# Altium project Rover_Carrier.PrjPcb
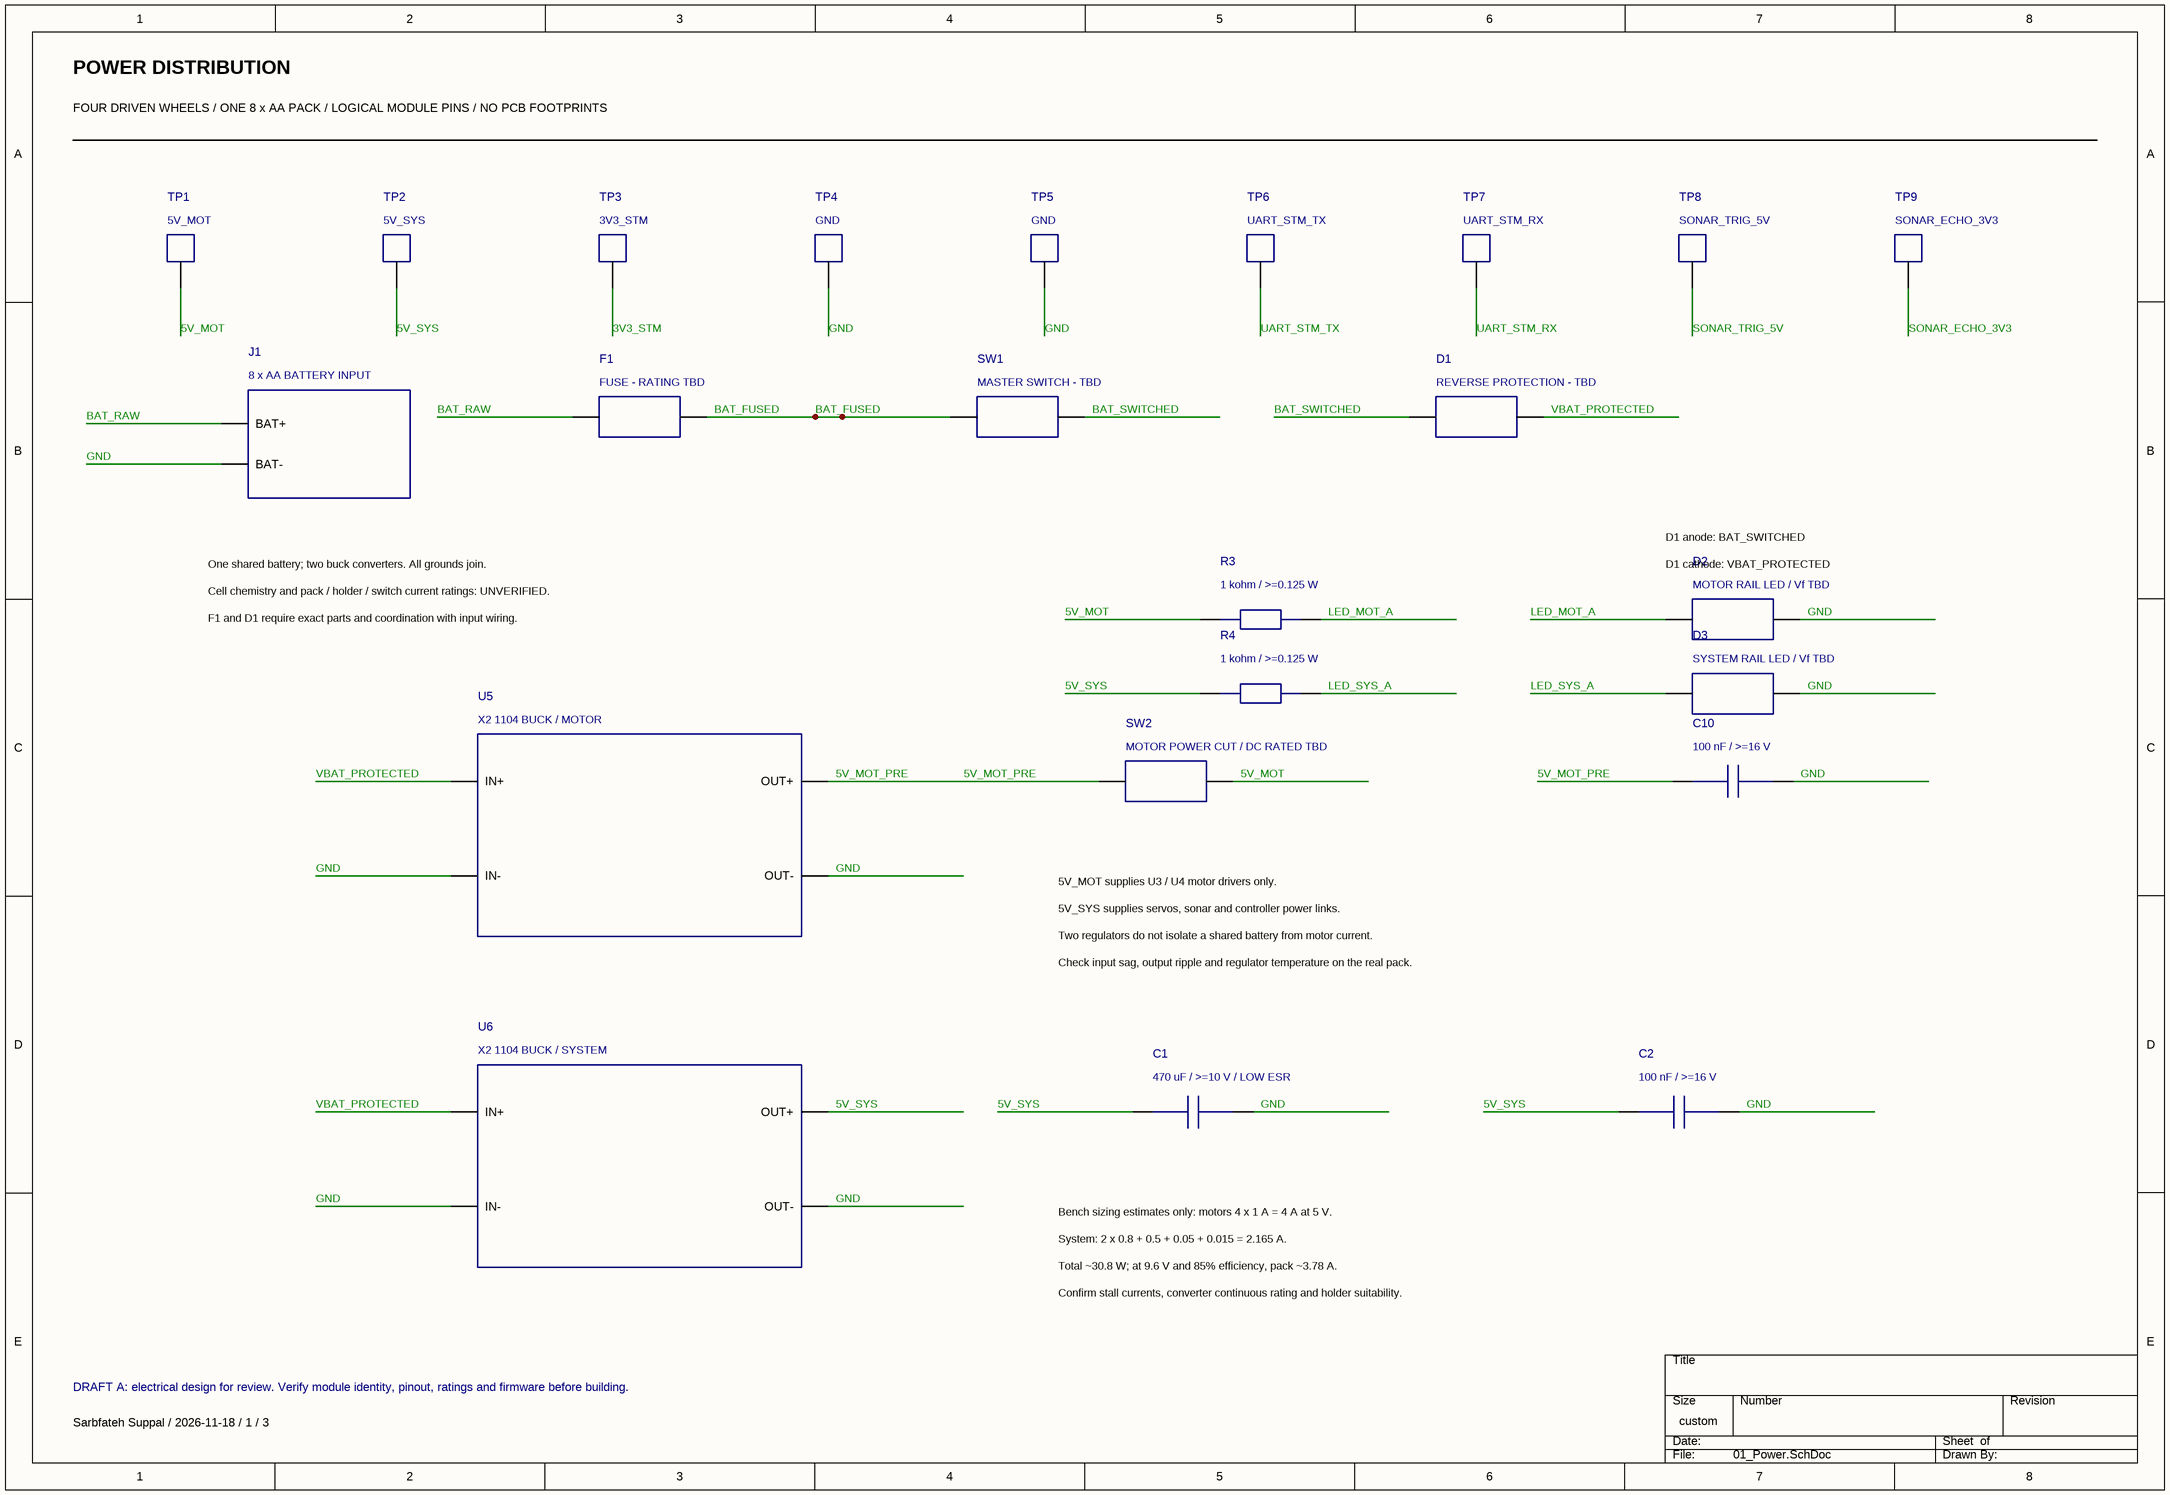
[diagram p0: 01_Power.SchDoc]
3 sheets, 55 parts. Net scope: global (net labels, ports and power ports of the same name join across sheets).
Sheets:
  01_Power.SchDoc
  02_Control_and_Sensors.SchDoc
  03_Drivers_and_Sonar.SchDoc

## Sheet 01_Power.SchDoc: POWER DISTRIBUTION
size 406 x 279 mm; Revision: A - DRAFT; Date: 2026-11-18; SheetNumber: 1; SheetTotal: 3; Author: Sarbfateh Suppal; DocumentNumber: ROVER-A-1; ProjectName: Four-motor Rover Carrier

### Parts
C1  470 uF / >=10 V / LOW ESR
C2  100 nF / >=16 V
C10  100 nF / >=16 V
D1  REVERSE PROTECTION - TBD
D2  MOTOR RAIL LED / Vf TBD
D3  SYSTEM RAIL LED / Vf TBD
F1  FUSE - RATING TBD
J1  8 x AA BATTERY INPUT
R3  1 kohm / >=0.125 W
R4  1 kohm / >=0.125 W
SW1  MASTER SWITCH - TBD
SW2  MOTOR POWER CUT / DC RATED TBD
TP1  5V_MOT
TP2  5V_SYS
TP3  3V3_STM
TP4  GND
TP5  GND
TP6  UART_STM_TX
TP7  UART_STM_RX
TP8  SONAR_TRIG_5V
TP9  SONAR_ECHO_3V3
U5  X2 1104 BUCK / MOTOR
U6  X2 1104 BUCK / SYSTEM

### Nets
3V3_STM: TP3.1
5V_MOT: R3.1 SW2.2 TP1.1
5V_MOT_PRE: C10.1 SW2.1 U5.OUT+
5V_SYS: C1.1 C2.1 R4.1 TP2.1 U6.OUT+
BAT_FUSED: F1.2 SW1.1
BAT_RAW: F1.1 J1.1(BAT+)
BAT_SWITCHED: D1.1 SW1.2
GND: C1.2 C2.2 C10.2 D2.2 D3.2 J1.2(BAT-) TP4.1 TP5.1 U5.IN- U5.OUT- U6.IN- U6.OUT-
LED_MOT_A: D2.1 R3.2
LED_SYS_A: D3.1 R4.2
SONAR_ECHO_3V3: TP9.1
SONAR_TRIG_5V: TP8.1
UART_STM_RX: TP7.1
UART_STM_TX: TP6.1
VBAT_PROTECTED: D1.2 U5.IN+ U6.IN+

### Notes on the sheet
- POWER DISTRIBUTION
- FOUR DRIVEN WHEELS / ONE 8 x AA PACK / LOGICAL MODULE PINS / NO PCB FOOTPRINTS
- One shared battery; two buck converters. All grounds join.
- D1 anode: BAT_SWITCHED
- (near D2) D1 cathode: VBAT_PROTECTED
- Cell chemistry and pack / holder / switch current ratings: UNVERIFIED.
- F1 and D1 require exact parts and coordination with input wiring.
- 5V_MOT supplies U3 / U4 motor drivers only.
- 5V_SYS supplies servos, sonar and controller power links.
- Two regulators do not isolate a shared battery from motor current.
- Check input sag, output ripple and regulator temperature on the real pack.
- Bench sizing estimates only: motors 4 x 1 A = 4 A at 5 V.
- System: 2 x 0.8 + 0.5 + 0.05 + 0.015 = 2.165 A.
- Total ~30.8 W; at 9.6 V and 85% efficiency, pack ~3.78 A.
- Confirm stall currents, converter continuous rating and holder suitability.
- DRAFT A: electrical design for review. Verify module identity, pinout, ratings and firmware before building.
- Sarbfateh Suppal / 2026-11-18 / 1 / 3

### Library data of the parts
C1 = capacitor_C1
C2 = capacitor_C2
C10 = capacitor_C10
D1 = diode_D1
D2 = led_D2
D3 = led_D3
F1 = fuse_F1
J1 = module_J1
R3 = resistor_R3
R4 = resistor_R4
SW1 = switch_SW1
SW2 = switch_SW2
TP1 = testpoint_TP1
TP2 = testpoint_TP2
TP3 = testpoint_TP3
TP4 = testpoint_TP4
TP5 = testpoint_TP5
TP6 = testpoint_TP6
TP7 = testpoint_TP7
TP8 = testpoint_TP8
TP9 = testpoint_TP9
U5 = module_U5
U6 = module_U6

## Sheet 02_Control_and_Sensors.SchDoc: CONTROLLERS, STEERING AND ULTRASONIC SENSOR
size 406 x 279 mm; Revision: A - DRAFT; Date: 2026-11-18; SheetNumber: 2; SheetTotal: 3; Author: Sarbfateh Suppal; DocumentNumber: ROVER-A-2; ProjectName: Four-motor Rover Carrier
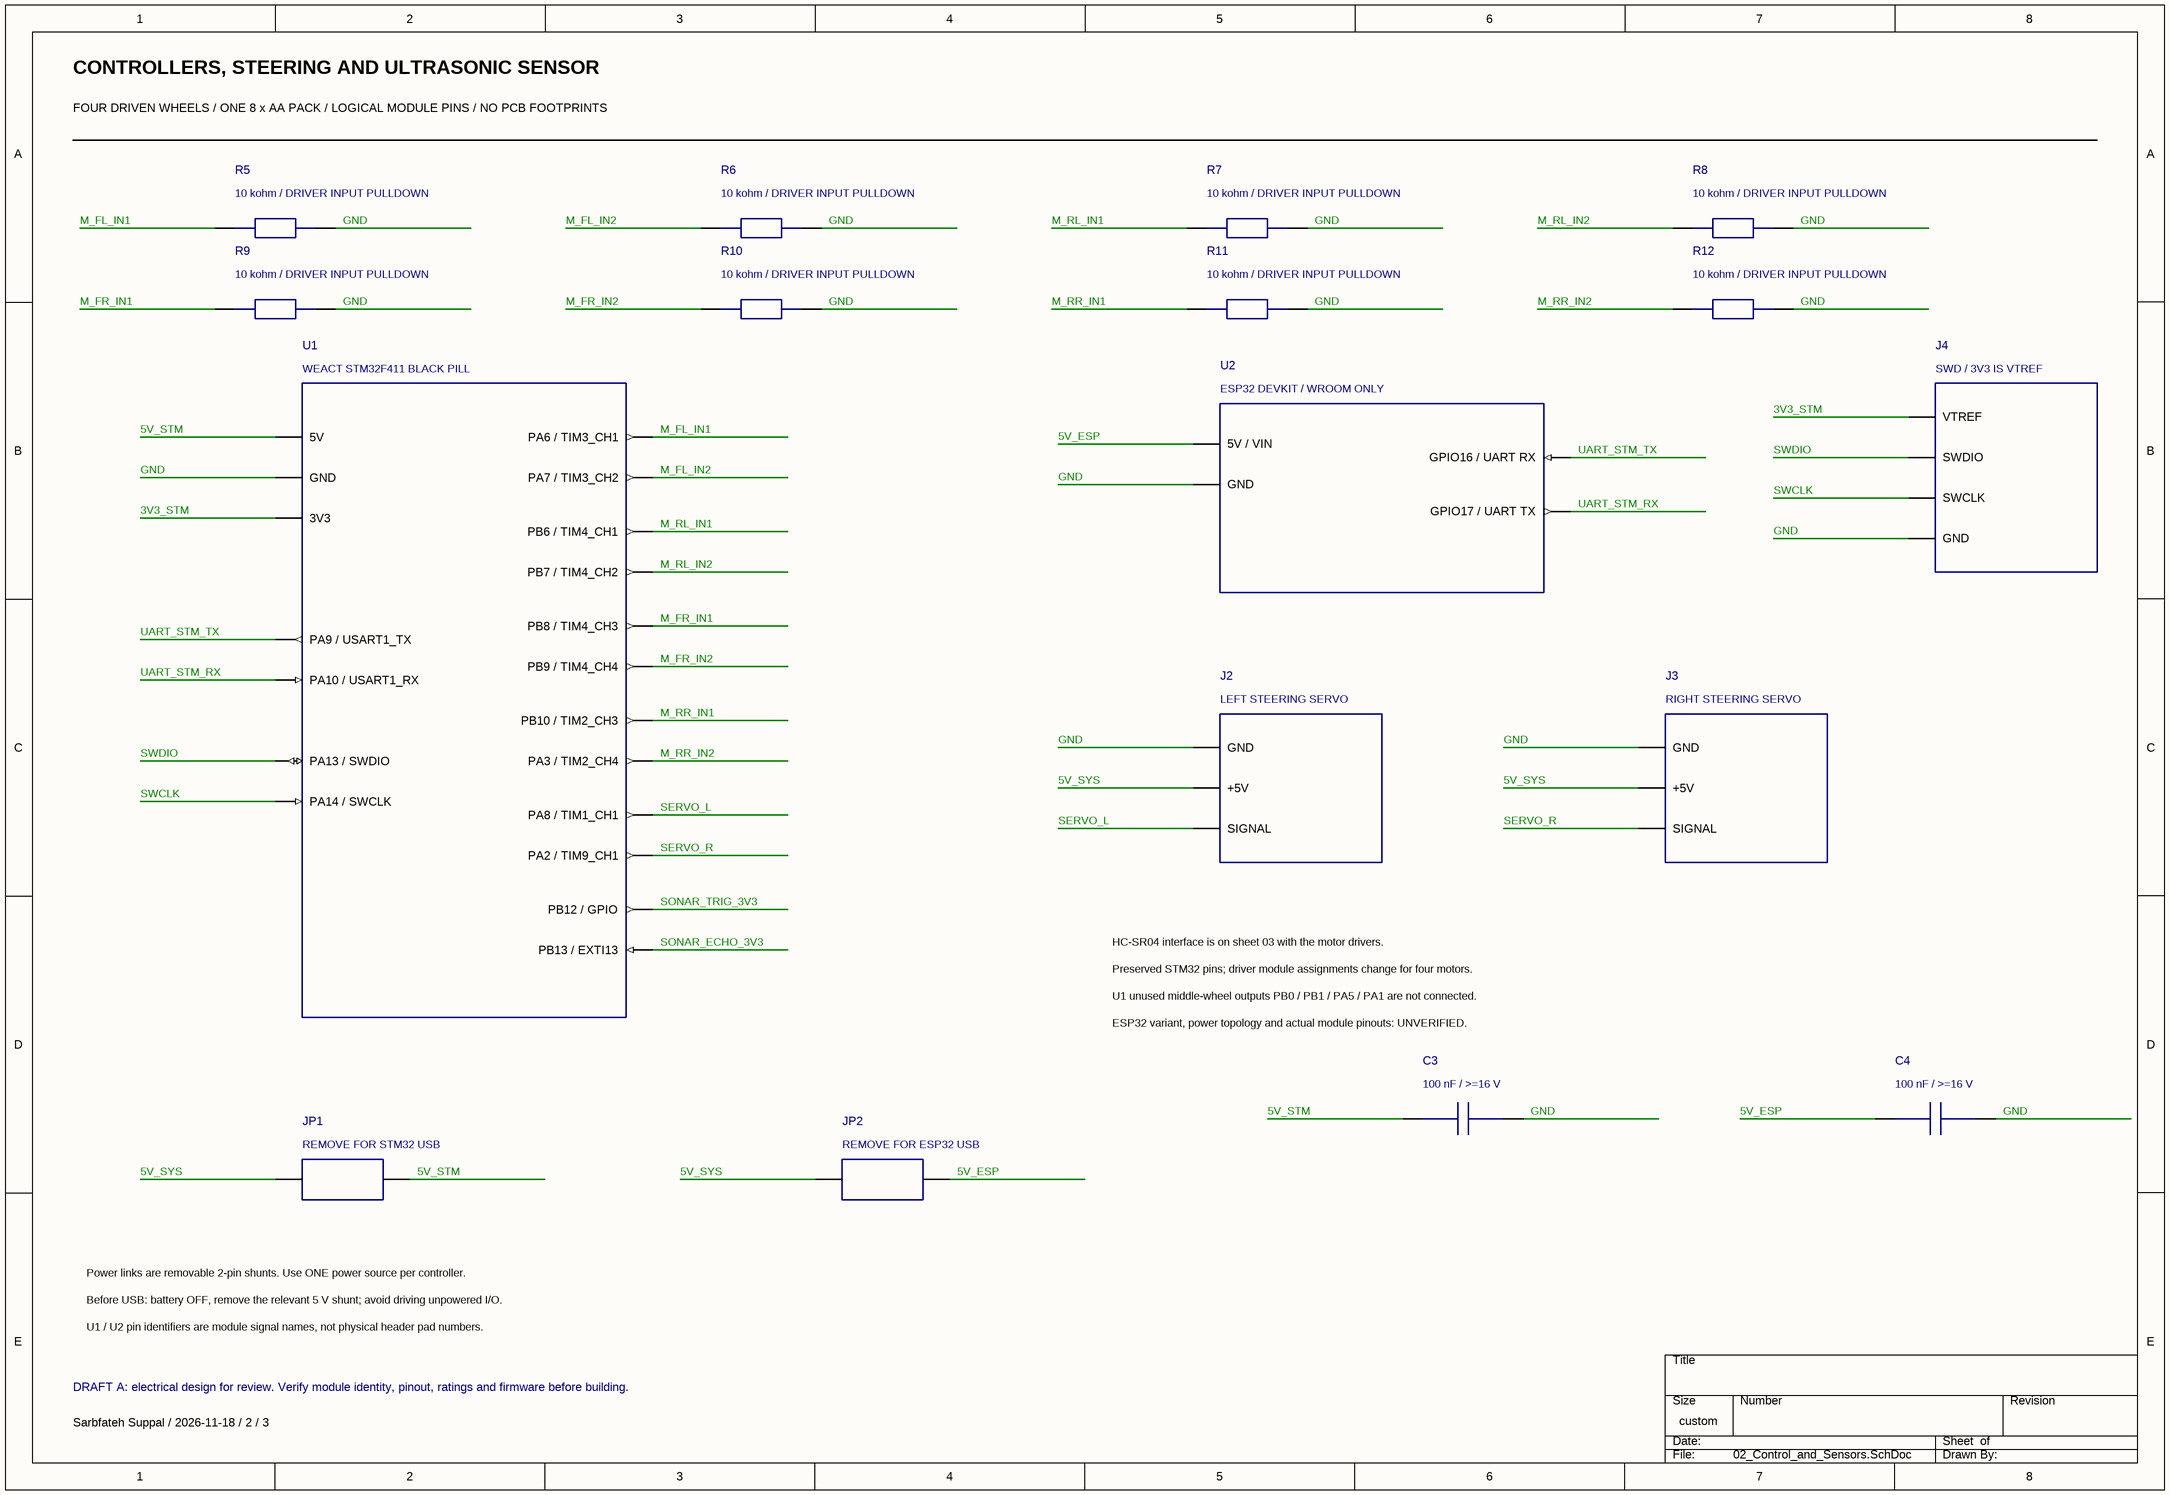
[diagram p1: 02_Control_and_Sensors.SchDoc]

### Parts
C3  100 nF / >=16 V
C4  100 nF / >=16 V
J2  LEFT STEERING SERVO
J3  RIGHT STEERING SERVO
J4  SWD / 3V3 IS VTREF
JP1  REMOVE FOR STM32 USB
JP2  REMOVE FOR ESP32 USB
R5  10 kohm / DRIVER INPUT PULLDOWN
R6  10 kohm / DRIVER INPUT PULLDOWN
R7  10 kohm / DRIVER INPUT PULLDOWN
R8  10 kohm / DRIVER INPUT PULLDOWN
R9  10 kohm / DRIVER INPUT PULLDOWN
R10  10 kohm / DRIVER INPUT PULLDOWN
R11  10 kohm / DRIVER INPUT PULLDOWN
R12  10 kohm / DRIVER INPUT PULLDOWN
U1  WEACT STM32F411 BLACK PILL
U2  ESP32 DEVKIT / WROOM ONLY

### Nets
3V3_STM: J4.1(VTREF) U1.3V3
5V_ESP: C4.1 JP2.2 U2.5V(5V_/_VIN)
5V_STM: C3.1 JP1.2 U1.5V
5V_SYS: J2.2(+5V) J3.2(+5V) JP1.1 JP2.1
GND: C3.2 C4.2 J2.1(GND) J3.1(GND) J4.4(GND) R5.2 R6.2 R7.2 R8.2 R9.2 R10.2 R11.2 R12.2 U1.GND U2.GND
M_FL_IN1: R5.1 U1.PA6(PA6_/_TIM3_CH1)
M_FL_IN2: R6.1 U1.PA7(PA7_/_TIM3_CH2)
M_FR_IN1: R9.1 U1.PB8(PB8_/_TIM4_CH3)
M_FR_IN2: R10.1 U1.PB9(PB9_/_TIM4_CH4)
M_RL_IN1: R7.1 U1.PB6(PB6_/_TIM4_CH1)
M_RL_IN2: R8.1 U1.PB7(PB7_/_TIM4_CH2)
M_RR_IN1: R11.1 U1.PB10(PB10_/_TIM2_CH3)
M_RR_IN2: R12.1 U1.PA3(PA3_/_TIM2_CH4)
SERVO_L: J2.3(SIGNAL) U1.PA8(PA8_/_TIM1_CH1)
SERVO_R: J3.3(SIGNAL) U1.PA2(PA2_/_TIM9_CH1)
SONAR_ECHO_3V3: U1.PB13(PB13_/_EXTI13)
SONAR_TRIG_3V3: U1.PB12(PB12_/_GPIO)
SWCLK: J4.3(SWCLK) U1.PA14(PA14_/_SWCLK)
SWDIO: J4.2(SWDIO) U1.PA13(PA13_/_SWDIO)
UART_STM_RX: U1.PA10(PA10_/_USART1_RX) U2.IO17(GPIO17_/_UART_TX)
UART_STM_TX: U1.PA9(PA9_/_USART1_TX) U2.IO16(GPIO16_/_UART_RX)

### Notes on the sheet
- CONTROLLERS, STEERING AND ULTRASONIC SENSOR
- FOUR DRIVEN WHEELS / ONE 8 x AA PACK / LOGICAL MODULE PINS / NO PCB FOOTPRINTS
- HC-SR04 interface is on sheet 03 with the motor drivers.
- Preserved STM32 pins; driver module assignments change for four motors.
- U1 unused middle-wheel outputs PB0 / PB1 / PA5 / PA1 are not connected.
- ESP32 variant, power topology and actual module pinouts: UNVERIFIED.
- Power links are removable 2-pin shunts. Use ONE power source per controller.
- Before USB: battery OFF, remove the relevant 5 V shunt; avoid driving unpowered I/O.
- U1 / U2 pin identifiers are module signal names, not physical header pad numbers.
- DRAFT A: electrical design for review. Verify module identity, pinout, ratings and firmware before building.
- Sarbfateh Suppal / 2026-11-18 / 2 / 3

### Library data of the parts
C3 = capacitor_C3
C4 = capacitor_C4
J2 = module_J2
J3 = module_J3
J4 = module_J4
JP1 = jumper_JP1
JP2 = jumper_JP2
R5 = resistor_R5
R6 = resistor_R6
R7 = resistor_R7
R8 = resistor_R8
R9 = resistor_R9
R10 = resistor_R10
R11 = resistor_R11
R12 = resistor_R12
U1 = module_U1
U2 = module_U2

## Sheet 03_Drivers_and_Sonar.SchDoc: MOTOR DRIVERS AND SENSOR INTERFACE
size 406 x 279 mm; Revision: A - DRAFT; Date: 2026-11-18; SheetNumber: 3; SheetTotal: 3; Author: Sarbfateh Suppal; DocumentNumber: ROVER-A-3; ProjectName: Four-motor Rover Carrier
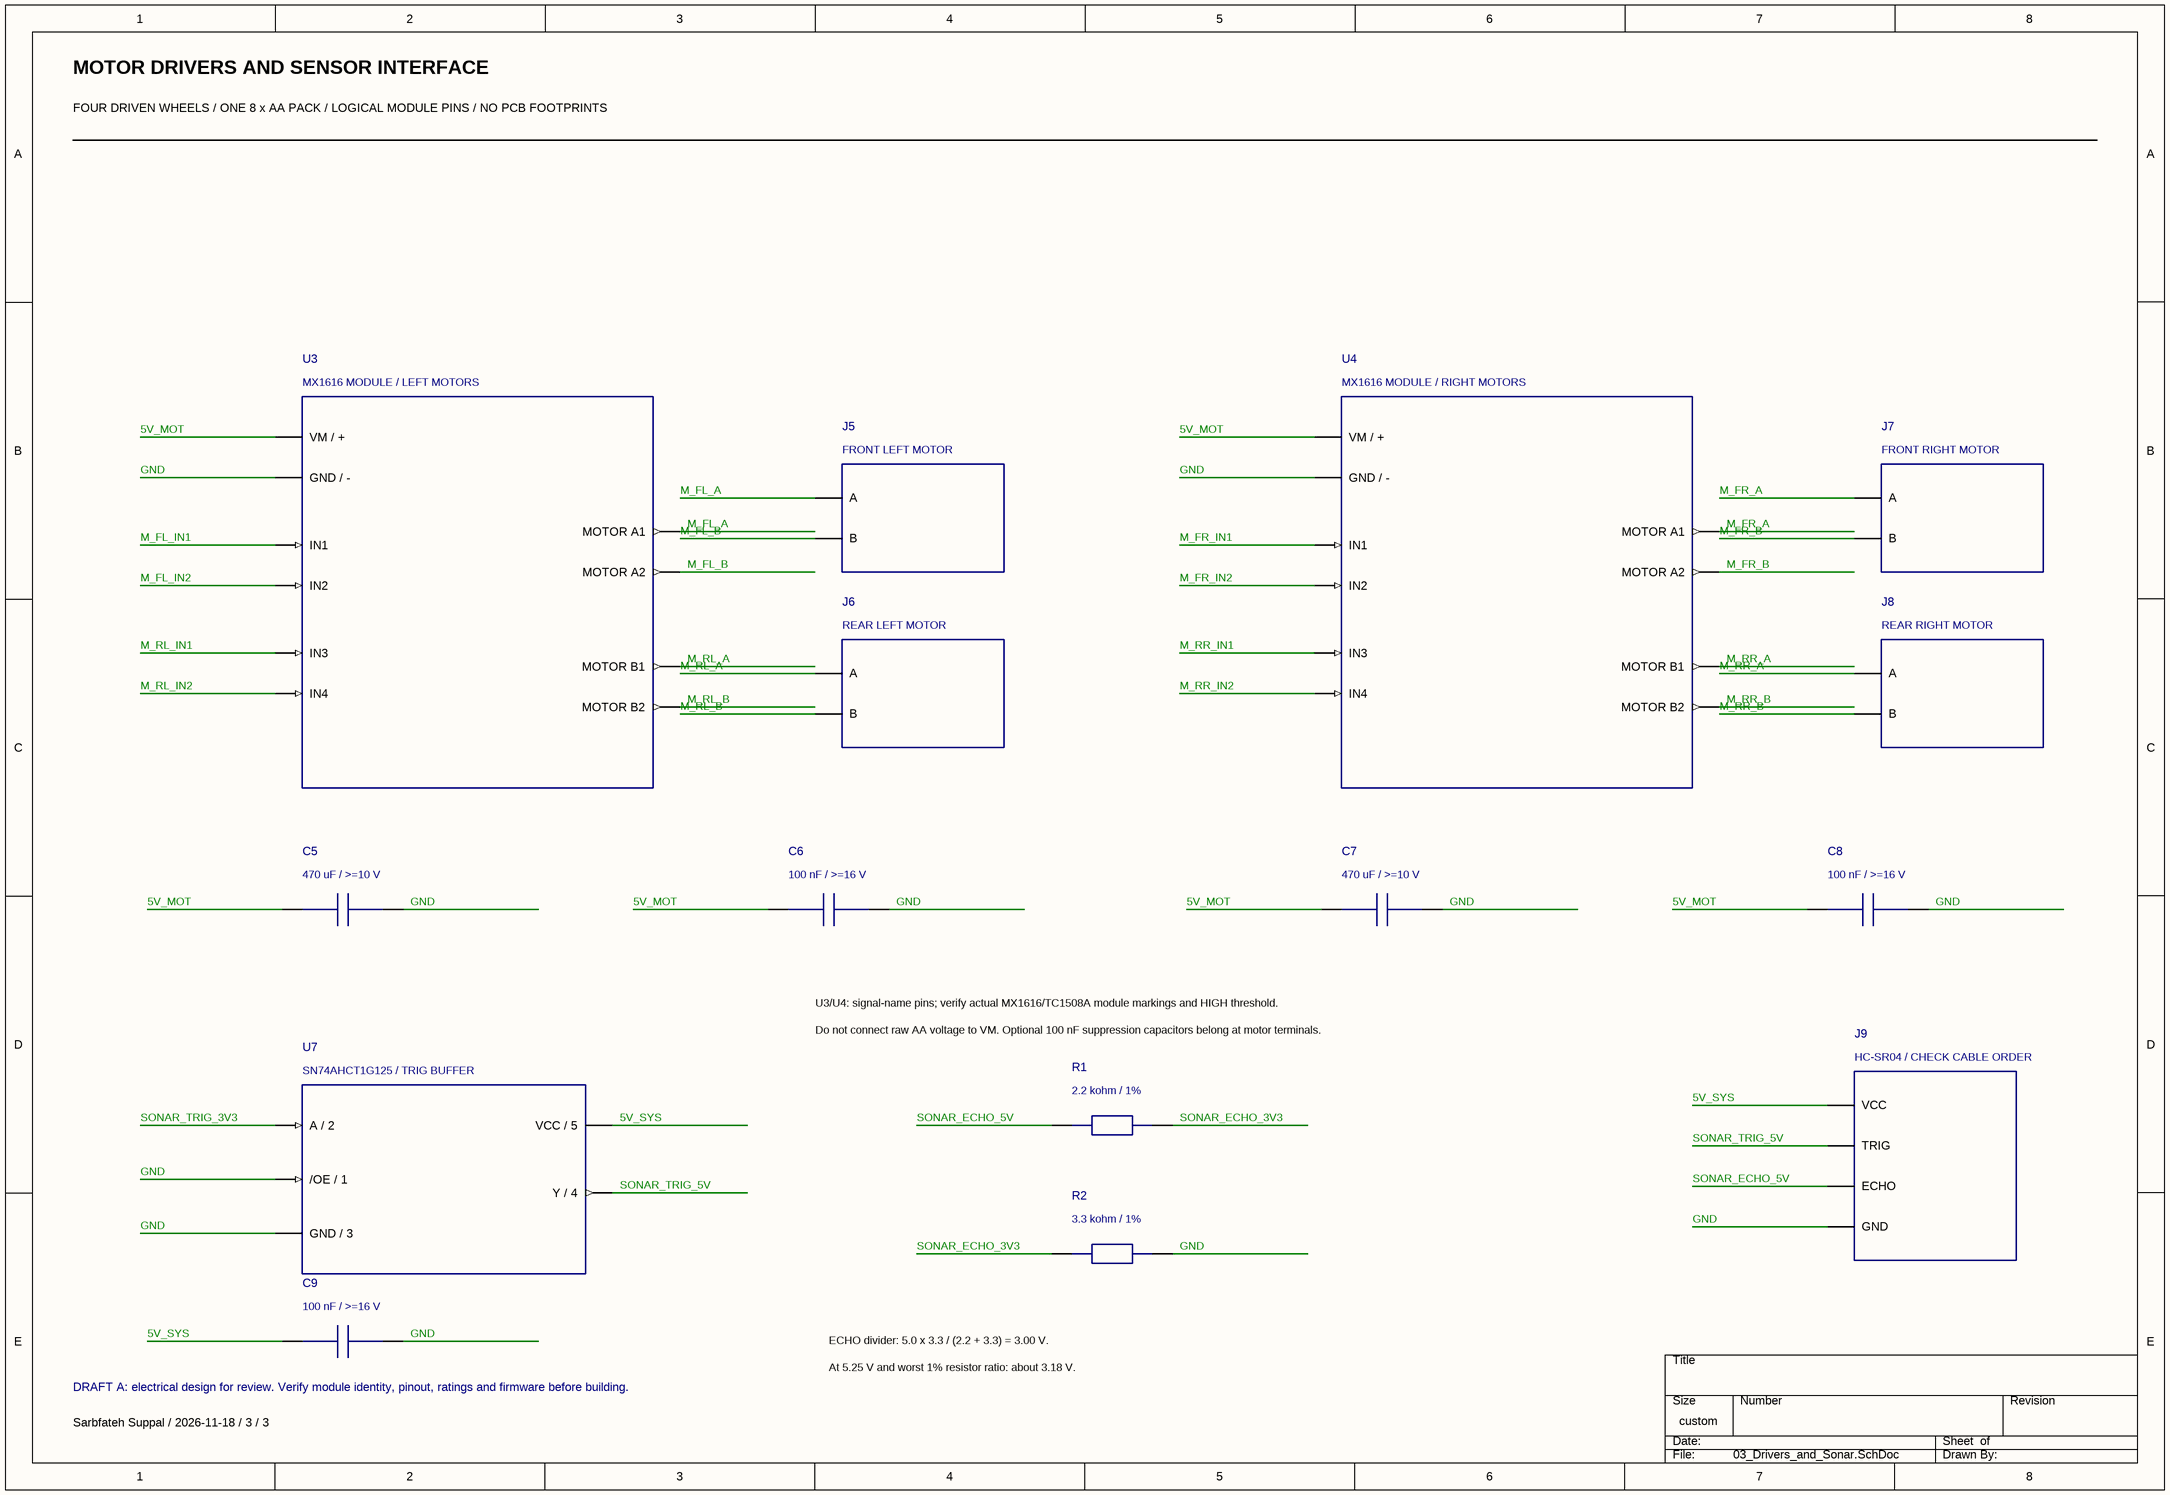
[diagram p2: 03_Drivers_and_Sonar.SchDoc]

### Parts
C5  470 uF / >=10 V
C6  100 nF / >=16 V
C7  470 uF / >=10 V
C8  100 nF / >=16 V
C9  100 nF / >=16 V
J5  FRONT LEFT MOTOR
J6  REAR LEFT MOTOR
J7  FRONT RIGHT MOTOR
J8  REAR RIGHT MOTOR
J9  HC-SR04 / CHECK CABLE ORDER
R1  2.2 kohm / 1%
R2  3.3 kohm / 1%
U3  MX1616 MODULE / LEFT MOTORS
U4  MX1616 MODULE / RIGHT MOTORS
U7  SN74AHCT1G125 / TRIG BUFFER

### Nets
5V_MOT: C5.1 C6.1 C7.1 C8.1 U3.VM(VM_/_+) U4.VM(VM_/_+)
5V_SYS: C9.1 J9.1(VCC) U7.5(VCC_/_5)
GND: C5.2 C6.2 C7.2 C8.2 C9.2 J9.4(GND) R2.2 U3.GND(GND_/_-) U4.GND(GND_/_-) U7.1(/OE_/_1) U7.3(GND_/_3)
M_FL_A: J5.1(A) U3.A1(MOTOR_A1)
M_FL_B: J5.2(B) U3.A2(MOTOR_A2)
M_FL_IN1: U3.IN1
M_FL_IN2: U3.IN2
M_FR_A: J7.1(A) U4.A1(MOTOR_A1)
M_FR_B: J7.2(B) U4.A2(MOTOR_A2)
M_FR_IN1: U4.IN1
M_FR_IN2: U4.IN2
M_RL_A: J6.1(A) U3.B1(MOTOR_B1)
M_RL_B: J6.2(B) U3.B2(MOTOR_B2)
M_RL_IN1: U3.IN3
M_RL_IN2: U3.IN4
M_RR_A: J8.1(A) U4.B1(MOTOR_B1)
M_RR_B: J8.2(B) U4.B2(MOTOR_B2)
M_RR_IN1: U4.IN3
M_RR_IN2: U4.IN4
SONAR_ECHO_3V3: R1.2 R2.1
SONAR_ECHO_5V: J9.3(ECHO) R1.1
SONAR_TRIG_3V3: U7.2(A_/_2)
SONAR_TRIG_5V: J9.2(TRIG) U7.4(Y_/_4)

### Notes on the sheet
- MOTOR DRIVERS AND SENSOR INTERFACE
- FOUR DRIVEN WHEELS / ONE 8 x AA PACK / LOGICAL MODULE PINS / NO PCB FOOTPRINTS
- U3/U4: signal-name pins; verify actual MX1616/TC1508A module markings and HIGH threshold.
- Do not connect raw AA voltage to VM. Optional 100 nF suppression capacitors belong at motor terminals.
- ECHO divider: 5.0 x 3.3 / (2.2 + 3.3) = 3.00 V.
- At 5.25 V and worst 1% resistor ratio: about 3.18 V.
- (near C9) DRAFT A: electrical design for review. Verify module identity, pinout, ratings and firmware before building.
- Sarbfateh Suppal / 2026-11-18 / 3 / 3

### Library data of the parts
C5 = capacitor_C5
C6 = capacitor_C6
C7 = capacitor_C7
C8 = capacitor_C8
C9 = capacitor_C9
J5 = module_J5
J6 = module_J6
J7 = module_J7
J8 = module_J8
J9 = module_J9
R1 = resistor_R1
R2 = resistor_R2
U3 = module_U3
U4 = module_U4
U7 = buffer_U7

## Nets that join several sheets
3V3_STM: 01_Power (TP3.1), 02_Control_and_Sensors (J4.1 U1.3V3)
5V_MOT: 01_Power (R3.1 SW2.2 TP1.1), 03_Drivers_and_Sonar (6 pins)
5V_SYS: 01_Power (5 pins), 02_Control_and_Sensors (J2.2 J3.2 JP1.1 JP2.1), 03_Drivers_and_Sonar (C9.1 J9.1 U7.5)
GND: 01_Power (12 pins), 02_Control_and_Sensors (15 pins), 03_Drivers_and_Sonar (11 pins)
M_FL_IN1: 02_Control_and_Sensors (R5.1 U1.PA6), 03_Drivers_and_Sonar (U3.IN1)
M_FL_IN2: 02_Control_and_Sensors (R6.1 U1.PA7), 03_Drivers_and_Sonar (U3.IN2)
M_FR_IN1: 02_Control_and_Sensors (R9.1 U1.PB8), 03_Drivers_and_Sonar (U4.IN1)
M_FR_IN2: 02_Control_and_Sensors (R10.1 U1.PB9), 03_Drivers_and_Sonar (U4.IN2)
M_RL_IN1: 02_Control_and_Sensors (R7.1 U1.PB6), 03_Drivers_and_Sonar (U3.IN3)
M_RL_IN2: 02_Control_and_Sensors (R8.1 U1.PB7), 03_Drivers_and_Sonar (U3.IN4)
M_RR_IN1: 02_Control_and_Sensors (R11.1 U1.PB10), 03_Drivers_and_Sonar (U4.IN3)
M_RR_IN2: 02_Control_and_Sensors (R12.1 U1.PA3), 03_Drivers_and_Sonar (U4.IN4)
SONAR_ECHO_3V3: 01_Power (TP9.1), 02_Control_and_Sensors (U1.PB13), 03_Drivers_and_Sonar (R1.2 R2.1)
SONAR_TRIG_3V3: 02_Control_and_Sensors (U1.PB12), 03_Drivers_and_Sonar (U7.2)
SONAR_TRIG_5V: 01_Power (TP8.1), 03_Drivers_and_Sonar (J9.2 U7.4)
UART_STM_RX: 01_Power (TP7.1), 02_Control_and_Sensors (U1.PA10 U2.IO17)
UART_STM_TX: 01_Power (TP6.1), 02_Control_and_Sensors (U1.PA9 U2.IO16)